# Altium project A_Board_Weather.Station.PrjPcb (part 2 of 2)

## Sheet A_Board_STM32F.SchDoc
size A2; SheetNumber: 2; SheetTotal: 4
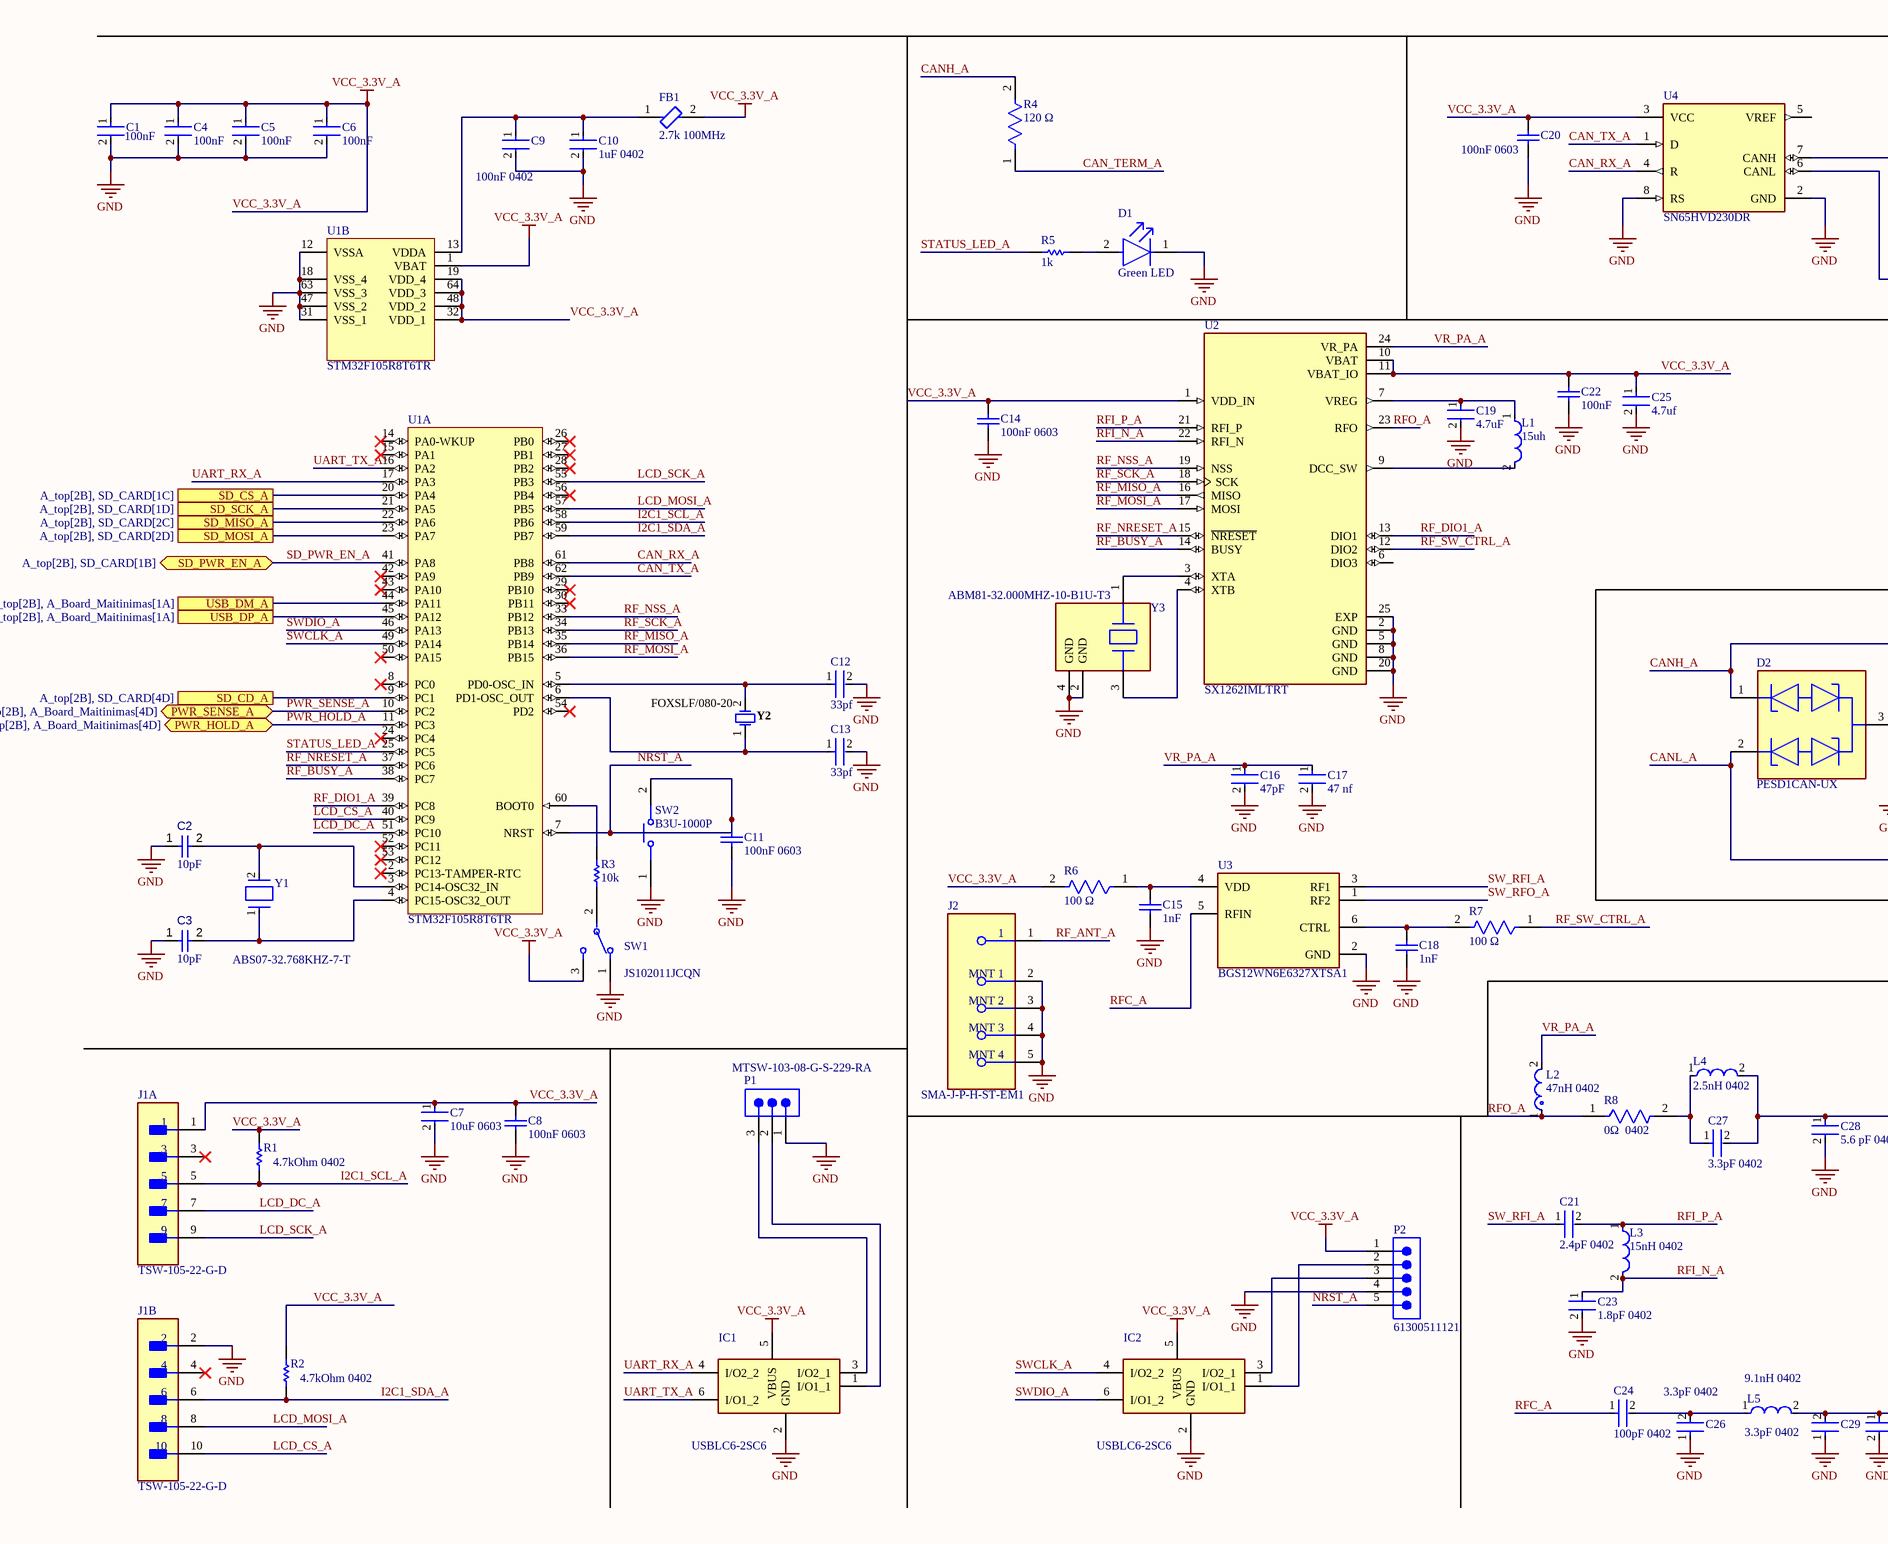
[diagram p2: A_Board_STM32F.SchDoc, left]
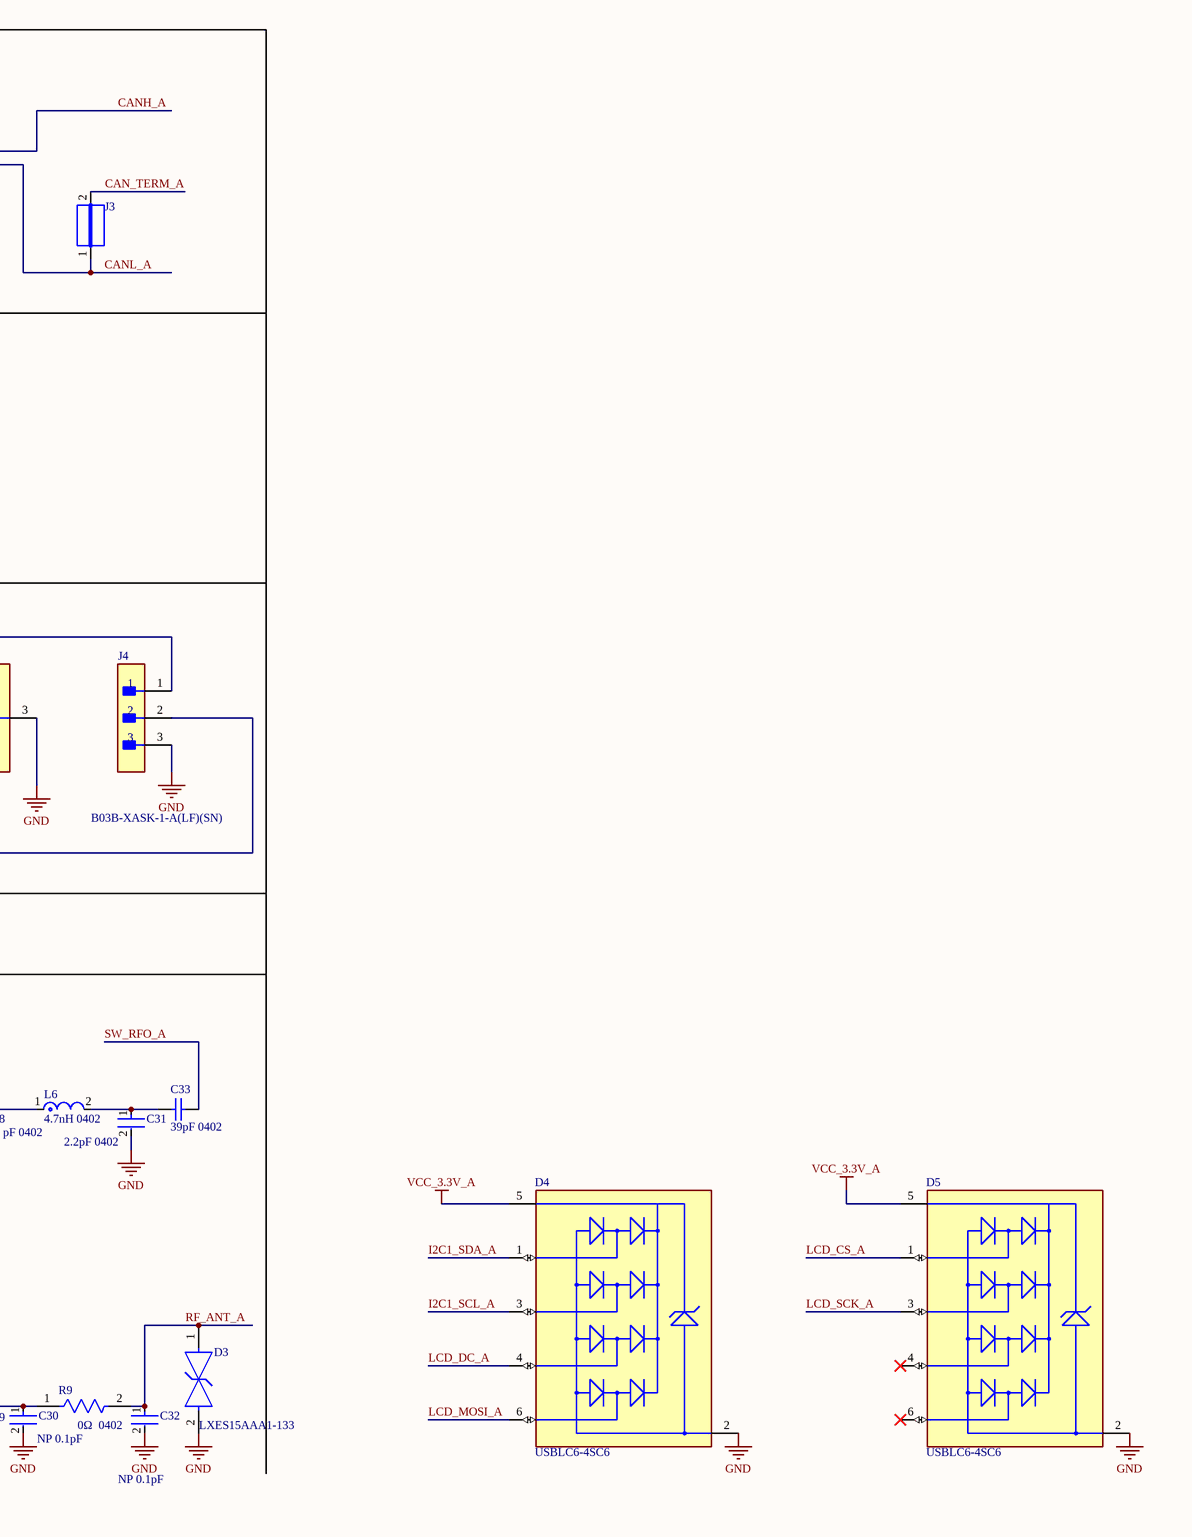
[diagram p3: A_Board_STM32F.SchDoc, right]

### Parts
C1  100nF  [FP-GRT155-0_05-IPC_B]
C2  value 10pF  [CAPC1608X90X40ML10T20]  (hidden comment: Capacitor 10 pF +/- 5% 50 V 0603)
C3  value 10pF  [CAPC1608X90X40ML10T20]  (hidden comment: Capacitor 10 pF +/- 5% 50 V 0603)
C4  100nF  [FP-GRT155-0_05-IPC_B]
C5  100nF  [FP-GRT155-0_05-IPC_B]
C6  100nF  [FP-GRT155-0_05-IPC_B]
C7  10uF 0603  [FP-ZRB18A-0_2-MFG]
C8  100nF 0603  [CAPC1608X90X35NL15T15]
C9  100nF 0402  [FP-GRT155-0_05-IPC_B]
C10  1uF 0402  [FP-CL440-IPC_C]
C11  100nF 0603  [CAPC1608X90X35NL15T15]
C12  33pf  [FP-CC0402-MFG]
C13  33pf  [FP-CC0402-MFG]
C14  100nF 0603  [CAPC1608X90X35NL15T15]
C15  1nF  [CAPC1005X60X30ML05T10]
C16  47pF  [FP-CC0402-0_05-0_55-L2_0-MFG]
C17  47 nf  [FP-C0402-BB-MFG]
C18  1nF  [CAPC1005X60X30ML05T10]
C19  4.7uF  [FP-CC1206-1_25-MFG]
C20  100nF 0603  [CAPC1608X90X35NL15T15]
C21  2.4pF 0402  [FP-GJM155-0_05-IPC_A]
C22  100nF  [CAPC1608X90X35NL15T15]
C23  1.8pF 0402  [FP-GJM155-0_05-IPC_B]
C24  100pF 0402  [FP-CC0402-MFG]
C25  4.7uf  [FP-CC1206-1_25-MFG]
C26  3.3pF 0402  [FP-GJM155-0_05-IPC_B]
C27  3.3pF 0402  [FP-GJM155-0_05-IPC_B]
C28  5.6 pF 0402  [FP-GJM155-0_05-MFG]
C29  3.3pF 0402  [FP-GJM155-0_05-IPC_B]
C30  NP 0.1pF  [FP-GJM155-0_05-IPC_B]
C31  2.2pF 0402  [FP-GJM155-0_05-IPC_C]
C32  NP 0.1pF  [FP-GJM155-0_05-IPC_B]
C33  39pF 0402  [CAPC1005X55X25LL05T10]
D1  Green LED  [FP-LTST-C171GKT-MFG]
D2  PESD1CAN-UX  [FP-SOT323-MFG]
D3  LXES15AAA1-133  [FP-LXES15-MFG]
D4  USBLC6-4SC6  [FP-SOT23-6L-MFG]
D5  USBLC6-4SC6  [FP-SOT23-6L-MFG]
FB1  2.7k 100MHz  [FP-BLM21-0_2-t1_25-e0_3-IPC_A]
IC1  USBLC6-2SC6  [SOT95P280X145-6N]
IC2  USBLC6-2SC6  [SOT95P280X145-6N]
J1  TSW-105-22-G-D  [FP-TSW-105-22-G-D-MFG]  (parts A,B of 2)
J2  SMA-J-P-H-ST-EM1  [FP-SMA-J-P-H-ST-EM1-MFG]
J3  JUMPER  [JUMPER]  (value not drawn)
J4  B03B-XASK-1-A(LF)(SN)  [FP-B03B-XASK-1-A_LF_SN-MFG]
L1  15uh  [FP-MLZ2012-1_25-IPC_C]
L2  47nH 0402  [FP-LQG15WH_02-IPC_C]
L3  15nH 0402  [FP-LQW15AN_00-W0_6-0_1-MFG]
L4  2.5nH 0402  [FP-LQW15AN_00-W0_6-0_1-MFG]
L5  9.1nH 0402  [FP-LQW15AN_00-W0_6-0_1-MFG]
L6  4.7nH 0402  [FP-LQG15HH_02-IPC_B]
P1  MTSW-103-08-G-S-229-RA  [SMTC-MTSW-103-08-X-S-229-RA]
P2  61300511121  [61300511121]
R1  4.7kOhm 0402  [RESC1005X40X25NL10T10]
R2  4.7kOhm 0402  [RESC1005X40X25NL10T10]
R3  10k  [RESC1005X40X25ML05T05]
R4  120 Ω  [FP-RMCF0201-IPC_B]
R5  1k  [RESC1005X40X25ML10T10]
R6  100 Ω  [FP-CRGCQ0402-IPC_C]
R7  100 Ω  [FP-CRGCQ0402-IPC_C]
R8  0Ω  0402  [FP-CRCW0402-e3-IPC_C]
R9  0Ω  0402  [FP-CRCW0402-e3-IPC_C]
SW1  JS102011JCQN  [FP-JS102011JCQN-MFG]
SW2  B3U-1000P  [OMRON-B3U-1000_V]
U1  STM32F105R8T6TR  [STM-LQFP64_L]  (parts A,B of 2)
U2  SX1262IMLTRT  [QFN50P400X400X100-25N]
U3  BGS12WN6E6327XTSA1  [FP-PG-TSNP-6-MFG]
U4  SN65HVD230DR  [FP-D0008A-IPC_A]
Y1  ABS07-32.768KHZ-7-T  [FP-ABS07-MFG]
Y2  FOXSLF/080-20  [FOX-FOXSLF080-20]
Y3  ABM81-32.000MHZ-10-B1U-T3  [FP-ABM81-MFG]

### Ports
PWR_HOLD_A (bidir, see A_top[2B], A_Board_Maitinimas[4D]), PWR_SENSE_A (bidir, see A_top[2B], A_Board_Maitinimas[4D]), SD_CD_A (see A_top[2B], SD_CARD[4D]), SD_CS_A (see A_top[2B], SD_CARD[1C]), SD_MISO_A (see A_top[2B], SD_CARD[2C]), SD_MOSI_A (see A_top[2B], SD_CARD[2D]), SD_PWR_EN_A (bidir, see A_top[2B], SD_CARD[1B]), SD_SCK_A (see A_top[2B], SD_CARD[1D]), USB_DM_A (see A_top[2B], A_Board_Maitinimas[1A]), USB_DP_A (see A_top[2B], A_Board_Maitinimas[1A])

### Nets
GND: C1.2 C2.1 C3.1 C4.2 C5.2 C6.2 C7.2 C8.1 C9.2 C10.2 C11.1 C12.2 C13.2 C14.1 C15.1 C16.2 C17.2 C18.1 C19.2 C20.1 C22.1 C23.2 C25.2 C26.1 C28.2 C29.1 C30.2 C31.2 C32.2 D1.1(C) D2.3(common_cathode) D3.2 D4.2(GND) D5.2(GND) IC1.2(GND) IC2.2(GND) J1.2 J2.2(MNT_1) J2.3(MNT_2) J2.4(MNT_3) J2.5(MNT_4) J4.3 P1.1 P2.4 SW1.1 SW2.1 U1.12(VSSA) U1.18(VSS_4) U1.31(VSS_1) U1.47(VSS_2) U1.63(VSS_3) U2.2(GND) U2.5(GND) U2.8(GND) U2.20(GND) U2.25(EXP) U3.2(GND) U4.2(GND) U4.8(RS) Y3.2(GND) Y3.4(GND)
VCC_3.3V_A: C1.1 C4.1 C5.1 C6.1 C7.1 C8.2 C14.2 C20.2 C22.2 C25.1 D4.5(VBUS) D5.5(VBUS) FB1.2 IC1.5(VBUS) IC2.5(VBUS) J1.1 P2.1 R1.2 R2.2 R6.2 SW1.3 U1.1(VBAT) U1.19(VDD_4) U1.32(VDD_1) U1.48(VDD_2) U1.64(VDD_3) U2.1(VDD_IN) U2.10(VBAT) U2.11(VBAT_IO) U4.3(VCC)
CAN_RX_A: U1.61(PB8) U4.4(R)
CAN_TERM_A: J3.2 R4.1
CAN_TX_A: U1.62(PB9) U4.1(D)
CANH_A: D2.1(cathode_1) J4.1 R4.2 U4.7(CANH)
CANL_A: D2.2(cathode_2) J3.1 J4.2 U4.6(CANL)
I2C1_SCL_A: D4.3(I/O2) J1.5 R1.1 U1.58(PB6)
I2C1_SDA_A: D4.1(I/O1) J1.6 R2.1 U1.59(PB7)
LCD_CS_A: D5.1(I/O1) J1.10 U1.40(PC9)
LCD_DC_A: D4.4(I/O3) J1.7 U1.51(PC10)
LCD_MOSI_A: D4.6(I/O4) J1.8 U1.57(PB5)
LCD_SCK_A: D5.3(I/O2) J1.9 U1.55(PB3)
NRST_A: C11.2 P2.5 SW2.2 U1.7(NRST)
PWR_HOLD_A: U1.11(PC3) ; port PWR_HOLD_A
PWR_SENSE_A: U1.10(PC2) ; port PWR_SENSE_A
RF_ANT_A: C32.1 D3.1 J2.1 R9.2
RF_BUSY_A: U1.38(PC7) U2.14(BUSY)
RF_DIO1_A: U1.39(PC8) U2.13(DIO1)
RF_MISO_A: U1.35(PB14) U2.16(MISO)
RF_MOSI_A: U1.36(PB15) U2.17(MOSI)
RF_NRESET_A: U1.37(PC6) U2.15(~{NRESET})
RF_NSS_A: U1.33(PB12) U2.19(NSS)
RF_SCK_A: U1.34(PB13) U2.18(SCK)
RF_SW_CTRL_A: R7.1 U2.12(DIO2)
RFC_A: C24.1 U3.5(RFIN)
RFI_N_A: C23.1 L3.2 U2.22(RFI_N)
RFI_P_A: C21.2 L3.1 U2.21(RFI_P)
RFO_A: L2.1 R8.1 U2.23(RFO)
SD_CD_A: U1.9(PC1) ; port SD_CD_A
SD_CS_A: U1.20(PA4) ; port SD_CS_A
SD_MISO_A: U1.22(PA6) ; port SD_MISO_A
SD_MOSI_A: U1.23(PA7) ; port SD_MOSI_A
SD_PWR_EN_A: U1.41(PA8) ; port SD_PWR_EN_A
SD_SCK_A: U1.21(PA5) ; port SD_SCK_A
STATUS_LED_A: R5.1 U1.25(PC5)
SW_RFI_A: C21.1 U3.3(RF1)
SW_RFO_A: C33.2 U3.1(RF2)
SWCLK_A: IC2.4(I/O2_2) U1.49(PA14)
SWDIO_A: IC2.6(I/O1_2) U1.46(PA13)
UART_RX_A: IC1.4(I/O2_2) U1.17(PA3)
UART_TX_A: IC1.6(I/O1_2) U1.16(PA2)
VR_PA_A: C16.1 C17.1 L2.2 U2.24(VR_PA)
NetC2_2: C2.2 U1.3(PC14-OSC32_IN) Y1.2
NetC3_2: C3.2 U1.4(PC15-OSC32_OUT) Y1.1
NetC9_1: C9.1 C10.1 FB1.1 U1.13(VDDA)
NetC12_1: C12.1 U1.5(PD0-OSC_IN) Y2.2
NetC13_1: C13.1 U1.6(PD1-OSC_OUT) Y2.1
NetC15_2: C15.2 R6.1 U3.4(VDD)
NetC18_2: C18.2 R7.2 U3.6(CTRL)
NetC19_1: C19.1 L1.1 U2.7(VREG)
NetC24_2: C24.2 C26.2 L5.1
NetC27_1: C27.1 L4.1 R8.2
NetC27_2: C27.2 C28.1 L4.2 L6.1
NetC29_2: C29.2 C30.1 L5.2 R9.1
NetC31_1: C31.1 C33.1 L6.2
NetD1_2: D1.2(A) R5.2
NetIC1_1: IC1.1(I/O1_1) P1.2
NetIC1_3: IC1.3(I/O2_1) P1.3
NetIC2_1: IC2.1(I/O1_1) P2.2
NetIC2_3: IC2.3(I/O2_1) P2.3
NetIC3_4: U1.44(PA11) ; port USB_DM_A
NetIC3_6: U1.45(PA12) ; port USB_DP_A
NetL1_2: L1.2 U2.9(DCC_SW)
NetR3_1: R3.1 SW1.2
NetR3_2: R3.2 U1.60(BOOT0)
NetU2_3: U2.3(XTA) Y3.1
NetU2_4: U2.4(XTB) Y3.3

Not connected (* = marked no-connect by the designer): D5 4(I/O3)* 6(I/O4)*; J1 3* 4*; U1 2(PC13-TAMPER-RTC)* 8(PC0)* 14(PA0-WKUP)* 15(PA1)* 24(PC4)* 26(PB0)* 27(PB1)* 28(PB2)* 29(PB10)* 30(PB11)* 42(PA9)* 43(PA10)* 50(PA15)* 52(PC11)* 53(PC12)* 54(PD2)* 56(PB4)*; U2 6(DIO3); U4 5(VREF)

### Library data of the parts
C1 C4-C6 C9 = CMP-06035-021603-1: Multi-Layer Ceramic Capacitor 100nF 25V X7R ±10% 0402 Paper T/R
C2 C3 = CMP-001-00014-6: Chip Capacitor, 10 pF, +/- 5%, 50 V, 0603 (1608 Metric); Capacitor Type: Ceramic; Voltage Rating: 50V; RoHS Compliant: True; Case/Package: 0603; Max Operating Temperature: 125°C; Pins: 2; Tolerance: 5%; Mounting Technology: SM; Min Operating Temperature: -55°C
C7 = CMP-06035-062601-1: CAP CER 10UF 10V X7T 0603; Tolerance: 10%; Max Operating Temperature: 125°C; Min Operating Temperature: -55°C; Length: 0.063inch; Width: 0.031inch; Case Code (Imperial): 0603; Thickness: 0.047inch; Case/Package: 0603; Mount: Surface Mount; RoHS Compliant: Yes; Case Code (Metric): 1608; Voltage Rating: 10V; Packaging: Tape and Reel; Capacitance: 10uF
C8 C11 C14 C20 C22 = CMP-2006-02299-1: Part Number: C0603C104K4RAC7013; Manufacturer: Kemet
C10 = CMP-13271-000031-1: Cap Ceramic 1uF 35V X5R ±10% SMD 0402 +85°C Paper T/R; Voltage Rating: 35V; Mount: Surface Mount; Case Code (Metric): 1005; Thickness: 0.022inch; Capacitance: 1uF; Max Operating Temperature: 85°C; Width: 0.02inch; Tolerance: 10%; Length: 0.039inch; Packaging: Tape and Reel; Case Code (Imperial): 0402; Min Operating Temperature: -55°C; Case/Package: 0402
C12 C13 = CMP-03422-000353-1: CAP CER 33PF 50V C0G/NPO 0402; Manufacturer: YAGEO; Manufacturer Part Number: CC0402JRNPO9BN330; Tolerance: 5%; Automotive Grade: NA; Material: Ceramic; Temperature Characteristic: NP0; Temperature Coefficient: 30ppm/°C; ComponentLink2Description: Datasheet; Category: Cap; Height: 0.55mm; Device Class L3: Ceramic Capacitors; Lead Free: Yes; Temperature Range High: +125°C; Device Class L1: Passive Components; Automotive: No; Device Class L2: Capacitors; RoHS: TRUE; Digikey Description: CAP CER 33PF 50V C0G/NPO 0402; Octopart: https://octopart.com/cc0402jrnpo9bn330-yageo-39467613; Mouser Description: Multilayer Ceramic Capacitors MLCC - SMD/SMT 33pF 50V NPO 5%; Temperature: -55°C to +125°C; Value: 33pF; Temperature Range Low: -55°C; Package: CC0402; Capacitance: 33pF; Footprint Url: http://www.yageo.com/exep/pages/download/literatures/UPY-C_GEN_24.pdf; Ipc Land Pattern Name: CAPC10050X50; Voltage Rating: 50V; ComponentLink2URL: http://www.yageo.com/documents/recent/UPY-GP_NP0_16V-to-50V_16.pdf
C15 C18 = CMP-1034-01610-2: Part Number: C0402C102K9RACTU; Manufacturer: Kemet
C16 = CMP-00621-00192874-1: CC0402JRNPO9BN470 Multilayer Ceramic Capacitor, 47 pF, 50 V, ± 5%, C0G (NP0), 0402 [1005 Metric]; NexarPartId: 192874; Temperature Coefficient: 30ppm/°C; Voltage: 50V; Insulation Resistance: 100GΩ; Termination: SMD/SMT; Thickness: 558.8µm; RoHS: Compliant; Length: 1mm; Halogen Free: Halogen Free; Lead Free: Lead Free; Material: Ceramic; Number of Pins: 2; REACH SVHC: No SVHC; Schedule B: 8532240020, 8532240020; Radiation Hardening: No; Weight: 652.039032µg; Capacitance: 47pF; Min Operating Temperature: -55°C; Case/Package: 0402; Height: 550µm; Voltage Rating (DC): 50V; Composition: Ceramic; Case Code (Imperial): 0402; Max Operating Temperature: 125°C; Voltage Rating (AC): 50V; Dielectric Material: Ceramic; Voltage Rating: 50V; Mount: Surface Mount; Tolerance: 5%; Dielectric: C0G; Depth: 500µm; Case Code (Metric): 1005
C17 = CMP-03020-011259-1: CAP CER 0.047UF 16V X7R 0402; Manufacturer Part Number: C0402C473K4RACAUTO; Manufacturer: Kemet; Temperature Coefficient: 15%; Capacitance: 47,000 pF; Material: Ceramic; Tolerance: 0.1; Value: 47,000 pF; Voltage Rating: 16 V; Mouser Description: Cap Ceramic 0.047uF 16V X7R 10% Pad SMD 0402 125°C Automotive T/R; ComponentLink2Description: Datasheet; Temperature Range Low: -55°C; Ipc Land Pattern Name: CAPC10050X50; Digikey Description: CAP CER 0.047UF 16V X7R 0402; Device Class L2: Capacitors; Height: 0.55mm; ComponentLink2URL: https://content.kemet.com/datasheets/KEM_C1002_X7R_SMD.pdf; Temperature Characteristic: X7R; Lead Free: Yes; Octopart: https://octopart.com/c0402c473k4racauto-kemet-33302865; Device Class L1: Passive Components; Temperature: -55°C to +125°C; Category: Cap; Package: C0402-BB; Automotive: No; Temperature Range High: +125°C; Device Class L3: Ceramic Capacitors; RoHS: TRUE
C19 C25 = CMP-03422-000808-1: CC1206 4.7 uF X7R 10.00%25 V; Manufacturer Part Number: CC1206KFX7R8BB475; Manufacturer: Yageo; Automotive Grade: NA; Material: Ceramic; Voltage Rating: 25 V; Tolerance: 0.1; Temperature Coefficient: 15%; Device Class L2: Capacitors; Device Class L1: Passive Components; Category: Cap; Automotive: No; Capacitance: 4.7 uF; ComponentLink2URL: http://www.yageo.com/documents/recent/UPY-NP0X7R_HV_1KV-to-3KV_11.pdf; Octopart: https://octopart.com/cc1206kfx7r8bb475-yageo-80904472; Value: 4.7 uF; Footprint Url: http://www.yageo.com/exep/pages/download/literatures/UPY-C_GEN_24.pdf; Lead Free: Yes; Temperature Characteristic: X7R; ComponentLink2Description: Datasheet; Temperature Range Low: -55°C; Package: CC1206-1.25; RoHS: TRUE; Device Class L3: Ceramic Capacitors; Temperature: -55°C to +125°C; Height: 1.45mm; Temperature Range High: +125°C
C21 = CMP-2008-03838-2: Multi-Layer Ceramic Capacitor 2.4pF C0G  ±0.1pF 0402 Paper T/R; Voltage Rating: 50V; Height: 0.5mm; Dielectric: C0G; Thickness: 0.022inch; Case Code (Imperial): 0402; Width: 0.02inch; Max Operating Temperature: 125°C; Length: 1mm; Radiation Hardening: No; Min Operating Temperature: -55°C; Case/Package: 0402; Voltage Rating (DC): 50V; Depth: 0.5mm; Voltage: 50V; Mount: Surface Mount; Capacitance: 2.4pF; Termination: SMD/SMT; Lead Free: Lead Free; Package Quantity: 1; Packaging: Tape and Reel; Case Code (Metric): 1005
C23 = CMP-2008-03827-2: Multi-Layer Ceramic Capacitor 1.8pF C0G  ±0.05pF 0402 Paper T/R; Voltage Rating: 50V; Depth: 0.5mm; Length: 1mm; Case Code (Imperial): 0402; Case/Package: 0402; Min Operating Temperature: -55°C; Width: 0.5mm; Voltage Rating (DC): 50V; Termination: SMD/SMT; Case Code (Metric): 1005; Dielectric: C0G; Height: 0.5mm; Max Operating Temperature: 125°C; Lead Free: Lead Free; Thickness: 0.022inch; Packaging: Tape and Reel; Mount: Surface Mount; Radiation Hardening: No; Capacitance: 1.8pF; Package Quantity: 10000
C24 = CMP-03422-000275-1: CAP CER 100PF 25V X7R 0402; Manufacturer Part Number: CC0402KRX7R8BB101; Manufacturer: YAGEO; Material: Ceramic; Tolerance: 0.1; Automotive Grade: NA; Temperature Coefficient: 30ppm/°C; ComponentLink2Description: Datasheet; Device Class L2: Capacitors; Digikey Description: CAP CER 100PF 25V X7R 0402; Category: Cap; Ipc Land Pattern Name: CAPC10050X50; Height: 0.55mm; Lead Free: Yes; Temperature Range High: +125°C; Octopart: https://octopart.com/cc0402krx7r8bb101-yageo-71334371; Automotive: No; Device Class L3: Ceramic Capacitors; ComponentLink2URL: http://www.yageo.com/documents/recent/UPY-GP_NP0_16V-to-50V_16.pdf; Value: 100 pF; Voltage Rating: 25 V; Temperature: -55°C to +125°C; Capacitance: 100 pF; Temperature Characteristic: X7R; Footprint Url: http://www.yageo.com/exep/pages/download/literatures/UPY-C_GEN_24.pdf; Mouser Description: 0402 100 pF ±10% Tolerance X7R Multilayer Ceramic Chip Capacitor; Device Class L1: Passive Components; Temperature Range Low: -55°C; RoHS: TRUE; Package: CC0402
C26 C27 C29 = CMP-2008-03847-2: Multi-Layer Ceramic Capacitor 3.3pF C0G  ±0.25pF 0402 Paper T/R; Voltage: 50V; Length: 1mm; Dielectric: C0G; Capacitance: 3.3pF; Case Code (Metric): 1005; Max Operating Temperature: 125°C; Min Operating Temperature: -55°C; Case/Package: 0402; Package Quantity: 1; Termination: SMD/SMT; Thickness: 0.022inch; Width: 0.5mm; Mount: Surface Mount; Voltage Rating (DC): 50V; Height: 0.5mm; Voltage Rating: 50V; Lead Free: Lead Free; Radiation Hardening: No; Case Code (Imperial): 0402; Depth: 0.5mm; Packaging: Tape and Reel
C28 = CMP-2008-03865-2: Multi-Layer Ceramic Capacitor 5.6pF C0G  ±0.1pF 0402 Paper T/R; Voltage Rating (DC): 50V; Max Operating Temperature: 125°C; Capacitance: 5.6pF; Mount: Surface Mount; REACH SVHC: No SVHC; Case Code (Metric): 1005; Case/Package: 0402; Packaging: Tape and Reel; Min Operating Temperature: -55°C; Number of Pins: 2; Radiation Hardening: No; Package Quantity: 10000; Lead Pitch: 0.3mm; Width: 0.5mm; Voltage Rating: 50V; Thickness: 0.022inch; Length: 1mm; Termination: SMD/SMT; Height: 0.5mm; Case Code (Imperial): 0402; Depth: 0.5mm; Dielectric: C0G
C30 C32 = CMP-2008-03808-2: Multi-Layer Ceramic Capacitor 1pF C0G  ±0.1pF 0402 Paper T/R; Temperature Coefficient: 30ppm/°C; Voltage Rating (DC): 50V; REACH SVHC: No SVHC; Packaging: Tape and Reel; Width: 0.02inch; Package Quantity: 10000; Min Operating Temperature: -55°C; Case Code (Imperial): 0402; Lead Pitch: 0.3mm; Capacitance: 1pF; Length: 1mm; Max Operating Temperature: 125°C; Depth: 0.5mm; Thickness: 0.022inch; Case Code (Metric): 1005; Lead Free: Lead Free; Voltage: 50V; Mount: Surface Mount; Number of Pins: 2; Termination: SMD/SMT; Radiation Hardening: No; Dielectric: C0G; Case/Package: 0402; Voltage Rating: 50V; Height: 0.5mm
C31 = CMP-2008-03835-2: Multi-Layer Ceramic Capacitor 2.2pF C0G  ±0.1pF 0402 Paper T/R; Voltage Rating: 50V; Temperature Coefficient: 30ppm/°C; Width: 0.5mm; Dielectric: C0G; Mount: Surface Mount; Thickness: 0.022inch; Lead Pitch: 0.3mm; Depth: 0.5mm; Case Code (Metric): 1005; Lead Free: Lead Free; Min Operating Temperature: -55°C; Number of Pins: 2; Radiation Hardening: No; Case/Package: 0402; Voltage: 50V; Max Operating Temperature: 125°C; Height: 0.5mm; Package Quantity: 10000; Capacitance: 2.2pF; REACH SVHC: No SVHC; Packaging: Tape and Reel; Case Code (Imperial): 0402; Termination: SMD/SMT; Voltage Rating (DC): 50V; Length: 1mm
C33 = CMP-2008-03921-1: Part Number: GRM1555C1H390JA01D; Manufacturer: Murata
D1 = CMP-22017-000007-1: LED GREEN CLEAR CHIP SMD; Luminous Intensity: 12mcd; Lens Color: Colorless; Dominant Wavelength: 569nm; Number of LEDs: 1; Power Dissipation: 100mW; Viewing Angle: 130°; Reverse Voltage: 5V; Test Current: 10mA; Forward Voltage: 2.1V; Wavelength: 585nm; Lens Style: Diffused; Forward Current: 30mA; Height: 0.8mm; Mount: Surface Mount; Package Quantity: 1; Length: 2mm; Case Code (Metric): 2012; Number of Pins: 2; Number of Elements: 1; Packaging: Tape and Reel; Color: Green; Min Operating Temperature: -55°C; Case/Package: 0805; Power Rating: 100mW; Max Operating Temperature: 85°C; Radiation Hardening: No; Depth: 1.25mm; Lens Transparency: Clear; Width: 1.25mm; Lead Free: Lead Free; Case Code (Imperial): 0805; Illumination Color: Green
D2 = CMP-14436-000006-1: TVS DIODE 24V 50V SC70-3
D3 = CMP-06195-000011-1: TVS DIODE 15V 1005; Number of Bidirectional Channels: 1; Power Line Protection: No; Mount: Surface Mount; Case Code (Metric): 1005; Min Operating Temperature: -40°C; Case Code (Imperial): 0402; Resistor Type: Zener; Reverse Standoff Voltage: 15V; Case/Package: 0402; Packaging: Tape and Reel; Max Operating Temperature: 85°C
D4 D5 = CMP-2000-07370-2: TVS DIODE 5.25V 17V SOT23-6; Manufacturer: STMicroelectronics; Peak Pulse Power: 130W; Breakdown Voltage: 6V; Value: 3pF; Direction: Unidirectional; Interface: USB,Ethernet,Other; Number Of Channels: 4; Standoff Height: 0mm; Max Junction Temp: +125°C; Digikey Description: TVS DIODE 5.25V 17V SOT23-6; Automotive: No; Package: SOT23-6L; Mouser Description: USBLC6 Series 4 Line 6 V Uni / Bi-Directional ESD Protection - SOT-23-6; Octopart: https://octopart.com/usblc6-4sc6-stmicroelectronics-347147; RoHS: TRUE; ComponentLink2URL: https://upverter.com/datasheet/23dc4ffb028d868909e80577610284b194f13213.pdf; ComponentLink2Description: Datasheet; Device Class L1: Circuit Protection; Lead Free: Yes; Temperature Range High: +125°C; Device Class L2: ESD and Circuit Protection ICs; Device Class L3: unset; Capacitance: 3pF; Height: 1.45mm; Temperature Range Low: -40°C; Manufacturer Part Number: USBLC6-4SC6; Temperature: -40°C to +125°C; Category: Diode; Clamping Voltage: 17V
FB1 = CMP-06046-001048-1: FERRITE BEAD 2700 OHM 0201 1LN BLM21BD272SZ1L
IC1 IC2 = USBLC6-2SC6: Integrated Circuit; Manufacturer_Name: STMicroelectronics; Datasheet Link: https://www.st.com/resource/en/datasheet/usblc6-2.pdf; Height: 1.45mm; Manufacturer_Part_Number: USBLC6-2SC6; Mouser Part Number: 511-USBLC6-2SC6; Mouser Price/Stock: https://www.mouser.co.uk/ProductDetail/STMicroelectronics/USBLC6-2SC6?qs=po45yt2pPpu%2FhNIlwQdTlg%3D%3D; Arrow Part Number: USBLC6-2SC6; Arrow Price/Stock: https://www.arrow.com/en/products/usblc6-2sc6/stmicroelectronics.html?utm_currency=USD&region=asia
J1 = CMP-02766-000106-1: CONN HEADER VERT 10POS 2.54MM; Max Current Rating: 7.6A; Max Voltage Rating (AC): 550V; Number of Contacts: 10; Gender: Male; Length: 12.7mm; Depth: 5.08mm; Min Operating Temperature: -55°C; REACH SVHC: No SVHC; Termination: Solder; Number of Rows: 2; Housing Color: Black; Orientation: Straight; Pitch: 2.54mm; Contact Plating: Gold; Packaging: Bulk; Housing Material: Polyester; Contact Material: Bronze; Max Operating Temperature: 125°C
J2 = CMP-02754-000006-1: CONN SMA JACK STR 50OHM EDGE MNT; Dielectric Material: PTFE; Center Contact Plating: Gold; Max Frequency: 6GHz; Body Material: Brass; Voltage Rating: 335V; Impedance: 50R; Package Quantity: 1; Case/Package: SMA; Max Operating Temperature: 125°C; Fastening Type: Threaded; Orientation: Straight; Depth: 13.33mm; RoHS Compliant: Yes; Length: 6.35mm; Insulation Material: Polytetrafluoroethylene; Termination: Solder; Min Operating Temperature: -65°C; Housing Color: Gold; Contact Plating: Gold; Contact Material: Copper; Connector Type: SMA; Mount: Edge; Series: SMA; Packaging: Tray; Body Plating: Gold; Radiation Hardening: No
J3 = CMP-009-00061-2: Pins: 2
J4 = CMP-17439-000540-1: CONN HEADER VERT 3POS 2.5MM; Number of Positions: 3; Voltage Rating: 250V; Mated Stacking Heights: 11.3mm; Contact Shape: Circular; Pitch: 2.5mm; Lead Free: Lead Free; Connector Type: Header; Flammability Rating: UL94 V-0; Contact Material: Copper Alloy; Packaging: Bulk; Insulation Color: Natural; Fastening Type: Ramp; Contact Type: Male Pin; Series: XA; Termination: Press-Fit; Contact Finish - Mating: TIN; Insulation Material: Nylon; Number of Rows: 1; Mount: Through Hole
L1 = CMP-08253-000252-1: Shielded Multilayer Inductor 15uH ±20% 250mA 1235mΩ SMD 0805; Core Material: Ferrite; Saturation Current: 120mA; DC Resistance (DCR): 1.235R; Test Frequency: 2MHz; Self Resonant Frequency: 40MHz; Case/Package: 0805; Mount: Surface Mount; Package Quantity: 1; Current Rating: 250mA; Inductance: 15uH; Case Code (Metric): 2012; Max Operating Temperature: 125°C; Height - Seated (Max): 0.057inch; Width: 0.049inch; Length: 0.079inch; Shielding: Shielded; RoHS Compliant: Yes; Case Code (Imperial): 0805; Packaging: Tape and Reel; Min Operating Temperature: -55°C; Tolerance: 20%
L2 = CMP-06042-012463-1: Multilayer type Inductor for Automotive 47nH ±2% 1.6Ω 190mA 0402
L3 = CMP-06042-012641-1: Wire Wound RF Inductor 15nH ±2% 460mA 0.16Ω 0402 (1005); Core Material: Non-Magnetic; Current: 310mA; Self Resonant Frequency: 5GHz; Test Frequency: 100MHz; DC Resistance (DCR): 160mR; Shielding: Unshielded; Length: 1mm; REACH SVHC: No SVHC; Case Code (Imperial): 0402; Packaging: Tape and Reel; Case/Package: 0402; Weight: 2.8E-05oz; Current Rating: 460mA; Termination: SMD/SMT; Height - Seated (Max): 0.024inch; Inductance Tolerance: 2%; Height: 0.5mm; Military Standard: Not; Tolerance: 2%; Width: 0.5mm; Depth: 0.7mm; Min Operating Temperature: -55°C; Number of Pins: 2; Lead Free: Lead Free; Case Code (Metric): 1005; Max DC Current: 460mA; Max Operating Temperature: 125°C; Package Quantity: 10000; Mount: Surface Mount; Radiation Hardening: No; Resistor Type: Wirewound; DC Current: 460mA; Inductance: 15nH
L4 = CMP-06042-007620-1: Wire Wound RF Inductor 2.5nH ±0.1nH 850mA 0.05Ω 0402 (1005); Self Resonant Frequency: 15GHz; Core Material: Air; Q Factor: 20; DC Resistance (DCR): 50mR; Test Frequency: 100MHz; Shielding: Unshielded; Min Operating Temperature: -55°C; Case/Package: 0402; Military Standard: Not; Mount: Surface Mount; Packaging: Tape and Reel; Radiation Hardening: No; Height - Seated (Max): 0.024inch; Current Rating: 850mA; Inductance: 2.5nH; Height: 0.5mm; Max DC Current: 850mA; Case Code (Metric): 1005; Weight: 2.8E-05oz; Case Code (Imperial): 0402; Length: 1mm; Depth: 0.7mm; REACH SVHC: No SVHC; Width: 0.5mm; Max Operating Temperature: 125°C; Termination: SMD/SMT; Package Quantity: 1; Resistor Type: Wirewound; DC Current: 850mA
L5 = CMP-06042-009985-1: Wire Wound RF Inductor 9.1nH ±2% 540mA 0.14Ω 0402 (1005); Test Frequency: 100MHz; DC Resistance (DCR): 140mR; Core Material: Air; Shielding: Unshielded; Self Resonant Frequency: 5.5GHz; Q Factor: 25; Mount: Surface Mount; Length: 1mm; Width: 0.02inch; Packaging: Tape and Reel; Package Quantity: 1; Case Code (Imperial): 0402; Case/Package: 0402; Depth: 0.7mm; Number of Pins: 2; Min Operating Temperature: -55°C; Max DC Current: 540mA; DC Current: 540mA; REACH SVHC: No SVHC; Height: 0.5mm; Case Code (Metric): 1005; Max Operating Temperature: 125°C; Termination: SMD/SMT; Tolerance: 2%; Current Rating: 540mA; Inductance Tolerance: 2%; Weight: 2.8E-05oz; Military Standard: Not; Lead Free: Lead Free; Inductance: 9.1nH; Radiation Hardening: No
L6 = CMP-06042-003214-1: Multilayer type RF Inductor 4.7nH ±0.2nH 0.16Ω 700mA 0402; Self Resonant Frequency: 6GHz; Core Material: Air; DC Resistance (DCR): 160mR; Shielding: Unshielded; Test Frequency: 100MHz; Case Code (Metric): 1005; Packaging: Cut Tape; Case Code (Imperial): 0402; Max Operating Temperature: 125°C; Current Rating: 700mA; Inductance: 4.7nH; Mount: Surface Mount; Case/Package: 0402; Min Operating Temperature: -55°C
P1 = CMP-1024-00100-1: Modified .025" SQ Post Header, Through-hole, Right Angle, -55 to 125 degC, 2.54 mm Pitch, 3-Pin, Male, RoHS; Manufacturer: Samtec; Pitch: 2.54 mm; ComponentLink1URL: http://www.samtec.com; ComponentLink3Description: Package Specification; Mounting Technology: Through-hole; PackageDescription: Assembly .025" [.64] SQ Post Terminal Strip; ComponentLink2URL: http://www.samtec.com/documents/webfiles/pdf/MTSW.PDF; PackageVersion: BI, 2/1987; ComponentLink1Description: Manufacturer URL; PackageReference: MTSW-103-08-X-S-229-RA; Orientation: Right Angle; DatasheetVersion: F-214; PartNumber: MTSW-103-08-G-S-229-RA; RoHS: True; Temperature Range: -55 to 125 degC; ComponentLink3URL: http://www.samtec.com/documents/webfiles/cpdf/MTSW-XXX-XX-X-X-XXXX-XX-XXX-MKT1.pdf; ComponentLink2Description: Datasheet
P2 = CMP-1502-01068-4: THT Vertical Pin Header WR-PHD, Pitch 2.54 mm, Single Row, 5 pins; Number of Contacts: 5; Connector Type: Male Pin; Operating Supply Voltage: 250V; Contact Resistance: 20mΩ; Gender: Male; Pitch: 2.54mm; Current Rating: 3A; Min Operating Temperature: -40°C; Contact Material: Gold; Color: Black; RoHS: Compliant; Number of Rows: 1; Lead Free: Lead Free; Height: 8.89mm; Contact Plating: Gold; Number of Pins: 5; Orientation: Vertical; Voltage Rating: 250V; Packaging: Bulk; Number of Positions: 5; Max Operating Temperature: 105°C; Termination: Solder; Lead Pitch: 2.54mm; Contact Mating Length: 5.9944mm; Mount: Through Hole
R1 R2 = CMP-2002-05217-1: Manufacturer: Bourns; Part Number: CR0402-FX-4701GLF
R3 = CMP-2002-01181-1: Manufacturer: Panasonic; Part Number: ERT-J0EM103J
R4 = CMP-26527-005399-1: 120Ω ±5% 0.05W 0201 Thick Film Chip Resistor AEC-Q200 compliant; Resistance: 120R; Temperature Coefficient: 200ppm/°C; Max Power Dissipation: 50mW; Number of Terminations: 2; Mount: Surface Mount; Resistor Type: Thick Film; RoHS Compliant: Yes; Case/Package: 0201; Width: 0.012inch; Max Operating Temperature: 125°C; Tolerance: 5%; Radiation Hardening: No; Case Code (Metric): 0603; Min Operating Temperature: -55°C; Height: 0.009inch; Length: 0.024inch; Contact Plating: Tin; Case Code (Imperial): 0201; Packaging: Tape and Reel
R5 = CMP-2002-04581-1: Manufacturer: KOA Speer; Part Number: SG73P1ETTP1001F
R6 R7 = CMP-03211-004684-1: CRGCQ 0402 100R 5%; Manufacturer Part Number: CRGCQ0402J100R; Manufacturer: TE Connectivity; Value: 100Ω; Power Rating: 0.0625W; Temperature Coefficient: ±200ppm/°C; Voltage Rating: 50V; Tolerance: 0.05; RoHS: TRUE; ComponentLink2Description: Datasheet; Lead Free: Yes; Temperature: -55°C to +155°C; Series: CRGCQ; Package: CRGCQ0402; Composition: Thick Film; Digikey Description: CRGCQ 0402 100R 5%; Device Class L1: Passive Components; Temperature Range High: +155°C; Octopart: https://octopart.com/crgcq0402j100r-te+connectivity-91017992; Ambient Temperature Range High: +70°C; Device Class L3: Chip SMD Resistors; Automotive: Yes; ComponentLink2URL: https://www.te.com/commerce/DocumentDelivery/DDEController?Action=showdoc&DocId=Data+Sheet%7F1773204-3%7F1%7Fpdf%7FEnglish%7FENG_DS_1773204-3_1.pdf%7F4-2176347-467; Height: 0.4mm; Temperature Range Low: -55°C; Mouser Description: Res, Auto, Thick Film, 100R, 5%, 0402; Category: Res; Ipc Land Pattern Name: RESC10050X35; Resistance: 100Ω; Device Class L2: Resistors
R8 R9 = CMP-2002-08122-2: RES Thick Film, 0Ω, 0.063W, 0402; Tolerance: 5%; Max Power Dissipation: 63mW; Voltage Rating: 50V; Temperature Coefficient: 100ppm/°C; Resistance: 0mR; Contact Plating: Tin; Height: 0.35mm; Radiation Hardening: No; Features: Automotive AEC-Q200; Composition: Thick Film; Width: 0.5mm; Weight: 2.3E-05oz; Termination: SMD/SMT; Packaging: Tape and Reel; Mount: Surface Mount; Case Code (Metric): 1005; Military Standard: Not; Min Operating Temperature: -55°C; Number of Terminations: 2; Package Quantity: 1; Case Code (Imperial): 0402; Depth: 0.5mm; Max Operating Temperature: 155°C; Case/Package: 0402; Power Rating: 63mW; Lead Free: Lead Free; Voltage Rating (DC): 50V; Length: 1mm
SW1 = CMP-10038-000010-1: SWITCH SLIDE SPDT 300MA 6V; Electrical Life: 5000Cycles; Switch Function: On-On; Actuator Material: Nylon; Actuator Length: 2mm; Actuator Type: Standard; Current Rating: 300mA; Voltage Rating (DC): 6V; Min Operating Temperature: -40°C; Throw Configuration: SPDT; Mount: Surface Mount; Switch Travel: 2mm; Max Operating Temperature: 85°C; Packaging: Cut Tape; Contact Plating: Silver; Contact Material: Copper Alloy
SW2 = CMP-011-00000-2: Tactile Switch, SPST-NO, 0.05 A, 12 V, -25 to 70 degC, 2-Pin SMD, RoHS, Tape and Reel; Manufacturer: Omron Electronic Components; IP Rating: IP40; Current Rating: 50mA; Max Contact Resistance: 100mohm; Operating Force: 153gf; Throw Configuration: SPST; Resistance: 0.1Ohm; Max Voltage Rating (DC): 12V; Contact Material: Silver; Max Current Rating: 50mA; Datasheet URL: http://www.omron.com/ecb/products/pdf/en-b3u.pdf; Mounting Technology: SM; Case/Package: B3U-1000; Packaging: TapeandReel; Package Reference: B3U-1000; Manufacturer URL: http://www.omron.com/; Datasheet Version: Jan-15; RoHS Compliant: True; Max Operating Temperature: 70°C; Contact Current Rating: 50mA; Package Quantity: 3500; Package Description: 2-Pin Surface Mount Device, Body 3 x 2.5 mm; Voltage Rating (DC): 12V; Min Operating Temperature: -25°C; Voltage Rating: 12V
U1 = CMP-0237-00288-2: ARM Cortex-M3 32-bit MCU, 64 KB Flash, 64 KB Internal RAM, 51 I/Os, 64-pin LQFP, -40 to 85 degC, Tape and Reel; I/Os (High Current): 51; FLASH Size (Prog) (kB): 64; Operating Frequency(F) (Processor speed) (MHz): 72; Supply Voltage(Vcc) min (V): 2; A/D Converter: 2x12-bit (16 Channel); D/A Converter: 2x12-bit (2 Channel); PackageReference: LQFP64; PartNumber: STM32F105R8T6TR; Packing: Tape and Reel; ComponentLink3Description: Package Specification; ComponentLink2Description: Datasheet; PackageVersion: Rev. 4, 06/2013; ComponentLink3URL: http://www.st.com/st-web-ui/static/active/en/resource/technical/document/datasheet/DM00037051.pdf; ComponentLink2URL: http://www.st.com/st-web-ui/static/active/en/resource/technical/document/datasheet/CD00220364.pdf; Mounting Technology: Surface Mount; ComponentLink1URL: http://www.st.com/web/en/home.html; PackageDescription: 64-Pin Low Profile Quad Flat Package, 10 x 10 mm Body, 0.5 mm Pitch; Core: ARM Cortex-M3; Internal RAM Size (kB): 64; ComponentLink1Description: Manufacturer URL; DatasheetVersion: Rev. 6
U2 = SX1262IMLTRT: IC RF TxRx Only General ISM < 1GHz LoRaWAN 150MHz ~ 960MHz 24-VFQFN Exposed Pad; MF: Semtech Corporation; Value: *; SnapEDA_Link: https://www.snapeda.com/parts/SX1262IMLTRT/Semtech%20Corporation/view-part/2781045/?ref=snap; Availability: Unavailable; Package: VFQFN-24 Semtech; Price: None; MP: SX1262IMLTRT
U3 = CMP-32859-000005-1: CMOS SWITCH
U4 = CMP-0315-00015-3: IC TRANSCEIVER HALF 1/1 8SOIC; Number of Transceivers: 1; Operating Supply Voltage: 3.3V; Number of I/Os: 2; Max Supply Current: 17mA; Max Supply Voltage: 3.6V; Min Supply Voltage: 3V; Data Rate: 1Mbps; Min Operating Temperature: -40°C; Packaging: Tape and Reel; Lead Free: Lead Free; Number of Transmit Buffers: 1; Max Operating Temperature: 85°C; Number of Receive Buffers: 1; Number of Pins: 8; Package Quantity: 1; Radiation Hardening: No; Case/Package: D; REACH SVHC: No SVHC; Weight: 0.002561oz; Termination: SMD/SMT; Contact Plating: Gold; Nominal Supply Current: 17mA; Number of Receivers: 1; Number of Drivers: 1
Y1 = CMP-27762-014373-1: Crystal 32.768kHz ±20ppm (Tol) 7pF FUND 70kΩ 2-Pin CSMD T/R; Insulation Resistance: 500MR; Series Resistance: 70kR; Mount: Surface Mount; Tolerance: 20ppm; Length: 3.2mm; Lead Free: Lead Free; Frequency: 32.768kHz; Frequency Tolerance: 20ppm; Frequency Stability: 20ppm; Load Capacitance: 7pF; Radiation Hardening: No; Package Quantity: 3000; Width: 1.5mm; Height: 0.9mm; Termination: SMD/SMT; Max Operating Temperature: 85°C; Number of Pins: 2; Operating Frequency: 32.768 kHz; ESR (Equivalent Series Resistance): 70kR; Packaging: Tape and Reel; Series: ABS07; Min Operating Temperature: -40°C; Depth: 1.5mm; Case/Package: CSMD
Y2 = CMP-1749-00002-1: Resistance Weld Thru-Hole Crystal, 8 MHz, -20 to 70 degC, 2-Pin THD, RoHS, Bulk; Dropout Voltage: 2 V; Outputs: 1; Nominal Output Voltage: 5 V; Min Input Voltage: 7 V; Case\Package: TO-263-3; Max Input Voltage: 35 V; Max Ouput Current: 1 A; Length: 10.24 mm; Max Operating Temperature: 125 degC; Mount: Surface Mount; PackageDescription: 2-Pin Through Hole Device, Body 11.35 x 4.65 mm; Package Quantity: 50; Pins: 3; ComponentLink2URL: http://download.siliconexpert.com/pdfs/2015/4/5/6/5/7/200/fox_/manual/35607121449963728hc49slf.pdf; PackageReference: FOXSLF080-20; Min Operating Temperature: 0 degC; Height: 30.02 mm; Packaging: Rail/Tube; Radiation Hardening: No; Width: 9.35 mm; ComponentLink1URL: http://www.foxonline.com/; DatasheetVersion: Mar-15; ComponentLink1Description: Manufacturer URL; Output Voltage: 5 V; RoHSCompliant: true; REACH SVHC: No SVHC; Output Current: 1 A; ComponentLink2Description: Datasheet
Y3 = CMP-27762-001623-1: Crystal 32MHz ±10ppm 10pF SMD-4 3.2mm x 2.5mm; ESR (Equivalent Series Resistance): 40R; Frequency Tolerance: 10ppm; Max Operating Temperature: 70°C; RoHS Compliant: Yes; Frequency: 32MHz; Mount: Surface Mount; Width: 0.098inch; Min Operating Temperature: -20°C; Height: 0.028inch; Packaging: Tape and Reel; Frequency Stability: 10ppm; Length: 0.126inch; Package Quantity: 3000; Load Capacitance: 10pF; Case/Package: SMD/SMT

## Sheet SD_CARD.SchDoc
size A4; SheetNumber: 4; SheetTotal: 4
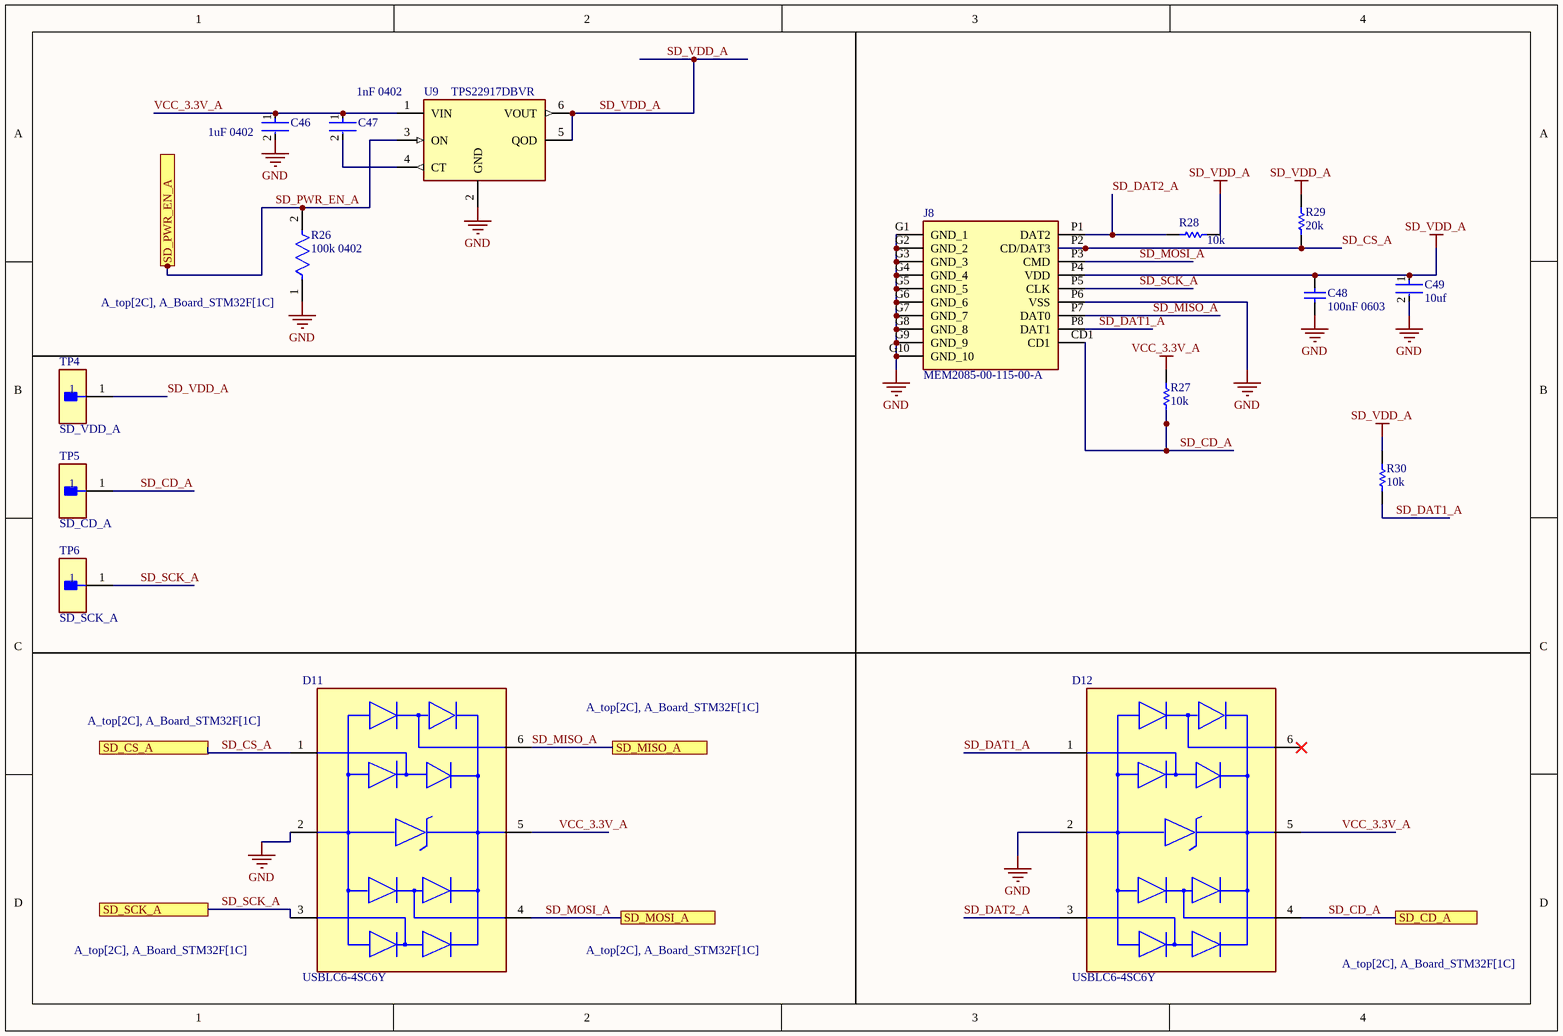
[diagram p4: SD_CARD.SchDoc]

### Parts
C46  1uF 0402  [FP-CL511-IPC_C]
C47  1nF 0402  [FP-C0402-BB-MFG]
C48  100nF 0603  [CAPC1608X90X35NL15T15]
C49  10uf  [FP-CL05A106MP5NUNC-MFG]
D11  USBLC6-4SC6Y  [FP-SOT23-6L-MFG]
D12  USBLC6-4SC6Y  [FP-SOT23-6L-MFG]
J8  MEM2085-00-115-00-A  [MEM20850011500A]
R26  100k 0402  [FP-CRGCQ0402-IPC_C]
R27  10k  [RESC0603X26X15LL03T05]
R28  10k  [RESC0603X26X15LL03T05]
R29  20k  [RESC1005X40X25ML05T05]
R30  10k  [RESC0603X26X15LL03T05]
TP4  SD_VDD_A  [FP-5015-MFG]
TP5  SD_CD_A  [FP-5015-MFG]
TP6  SD_SCK_A  [FP-5015-MFG]
U9  TPS22917DBVR  [FP-DBV0006A-IPC_A]

### Ports
SD_CD_A (see A_top[2C], A_Board_STM32F[1C]), SD_CS_A (see A_top[2C], A_Board_STM32F[1C]), SD_MISO_A (see A_top[2C], A_Board_STM32F[1C]), SD_MOSI_A (see A_top[2C], A_Board_STM32F[1C]), SD_PWR_EN_A (see A_top[2C], A_Board_STM32F[1C]), SD_SCK_A (see A_top[2C], A_Board_STM32F[1C])

### Nets
GND: C46.2 C48.1 C49.2 D11.2(GND) D12.2(GND) J8.G1(GND_1) J8.G2(GND_2) J8.G3(GND_3) J8.G4(GND_4) J8.G5(GND_5) J8.G6(GND_6) J8.G7(GND_7) J8.G8(GND_8) J8.G9(GND_9) J8.G10(GND_10) J8.P6(VSS) R26.1 U9.2(GND)
SD_VDD_A: C48.2 C49.1 J8.P4(VDD) R28.2 R29.2 R30.2 TP4.1 U9.5(QOD) U9.6(VOUT)
VCC_3.3V_A: C46.1 C47.1 D11.5(VBUS) D12.5(VBUS) R27.2 U9.1(VIN)
SD_CD_A: D12.4(I/O3) J8.CD1 R27.1 TP5.1 ; port SD_CD_A
SD_CS_A: D11.1(I/O1) J8.P2(CD/DAT3) R29.1 ; port SD_CS_A
SD_DAT1_A: D12.1(I/O1) J8.P8(DAT1) R30.1
SD_DAT2_A: D12.3(I/O2) J8.P1(DAT2) R28.1
SD_MISO_A: D11.6(I/O4) J8.P7(DAT0) ; port SD_MISO_A
SD_MOSI_A: D11.4(I/O3) J8.P3(CMD) ; port SD_MOSI_A
SD_PWR_EN_A: R26.2 U9.3(ON) ; port SD_PWR_EN_A
SD_SCK_A: D11.3(I/O2) J8.P5(CLK) TP6.1 ; port SD_SCK_A
NetC47_2: C47.2 U9.4(CT)

Not connected (* = marked no-connect by the designer): D12 6(I/O4)*

### Library data of the parts
C46 = CMP-13271-001936-1: Cap Ceramic 1uF 10V X5R ±10% SMD 0402 +85°C Paper T/R; Depth: 0.5mm; Case Code (Imperial): 0402; Material: Ceramic; Mount: Surface Mount; Thickness: 0.022inch; Dielectric: X5R; Capacitance: 1uF; Radiation Hardening: No; Case/Package: 0402; Length: 1mm; Tolerance: 10%; Max Operating Temperature: 85°C; Package Quantity: 1; Width: 0.02inch; Voltage Rating: 10V; Contact Plating: Tin; Height: 0.5mm; Min Operating Temperature: -55°C; Case Code (Metric): 1005; Packaging: Tape and Reel
C47 = CMP-2008-02358-3: C0402 1,000 pF X7R 10.00% 50 V; Manufacturer Part Number: C0402C102K5RAC7411; Manufacturer: Kemet; Voltage Rating: 50 V; Material: Ceramic; Tolerance: 0.1; Temperature Coefficient: 15%; Automotive: No; Temperature Characteristic: X7R; RoHS: TRUE; Category: Cap; Temperature: -55°C to +125°C; Lead Free: Yes; Value: 1,000 pF; Device Class L1: Passive Components; Temperature Range High: +125°C; Octopart: https://octopart.com/c0402c102k5rac7411-kemet-51077941; Capacitance: 1,000 pF; Ipc Land Pattern Name: CAPC10050X50; ComponentLink2URL: https://content.kemet.com/datasheets/KEM_C1002_X7R_SMD.pdf; ComponentLink2Description: Datasheet; Device Class L2: Capacitors; Package: C0402-BB; Device Class L3: Ceramic Capacitors; Mouser Description: Cap Ceramic 0.001uF 50V X7R 10% SMD 0402 125°C Punched Paper T/R; Height: 0.55mm; Temperature Range Low: -55°C
C48 = CMP-2006-02299-1: as C8 on sheet A_Board_STM32F
C49 = CMP-13271-000002-1: CAP CER 10UF 10V X5R 0402; Manufacturer Part Number: CL05A106MP5NUNC; Manufacturer: Samsung; Temperature Coefficient: 15%; Tolerance: 20%; Material: Ceramic; Octopart: https://octopart.com/cl05a106mp5nunc-samsung-22457395; Voltage Rating: 10V; RoHS: TRUE; Value: 10uF; Height: 0.7mm; Digikey Description: CAP CER 10UF 10V X5R 0402; Automotive: No; Package: CL05A106MP5NUNC; Device Class L1: Passive Components; Capacitance: 10uF; Temperature Range High: +85°C; ComponentLink2Description: Datasheet; Device Class L2: Capacitors; Temperature Characteristic: X5R; Temperature: -55°C to +85°C; ComponentLink2URL: http://www.samsungsem.com/kr/support/product-search/mlcc/__icsFiles/afieldfile/2019/05/10/19-CL05A106MP5NUNC.pdf; Device Class L3: Ceramic Capacitors; Category: Cap; Temperature Range Low: -55°C; Ipc Land Pattern Name: CAPC10050X50; Lead Free: Yes
D11 D12 = CMP-12225-000004-1: TVS DIODE 5.25V 17V SOT23-6; Manufacturer: STMicroelectronics; Automotive Grade: Grade 0; Max Junction Temp: +150°C; Number Of Channels: 4; Standoff Height: 0mm; Breakdown Voltage: 6V; Capacitance: 3pF; Value: 3pF; Direction: Unidirectional; Peak Pulse Current: 5A; Device Class L1: Circuit Protection; Device Class L2: TVS Diodes; Octopart: https://octopart.com/usblc6-4sc6y-stmicroelectronics-20614522; ComponentLink2Description: Datasheet; RoHS: TRUE; ComponentLink2URL: https://www.st.com/resource/en/datasheet/usblc6-4sc6y.pdf; Temperature Range Low: -40°C; Package: SOT23-6L; Automotive: Yes; Mouser Description: USBLC6 Series 4 Channel 5.25 V SMT Uni-Directinal Auto ESD Protection - SOT-23-6; Device Class L3: unset; Manufacturer Part Number: USBLC6-4SC6Y; Lead Free: Yes; Temperature Range High: +150°C; Category: Diode; Height: 1.45mm; Clamping Voltage: 17V; Temperature: -40°C to +150°C; Digikey Description: TVS DIODE 5.25V 17V SOT23-6
J8 = MEM2085-00-115-00-A: Connector; Manufacturer_Name: GCT (GLOBAL CONNECTOR TECHNOLOGY); Datasheet Link: https://gct.co/files/drawings/mem2085.pdf; Height: 1.35mm; Manufacturer_Part_Number: MEM2085-00-115-00-A; Mouser Part Number: 640-MEM20850011500A; Mouser Price/Stock: https://www.mouser.co.uk/ProductDetail/GCT/MEM2085-00-115-00-A?qs=rQFj71Wb1eWNkFUhuuvVIA%3D%3D
R26 = CMP-03211-001412-1: CRGCQ0402 100KΩ 1% ±100ppm/°C 50V; Manufacturer Part Number: CRGCQ0402F100K; Manufacturer: TE Connectivity; Tolerance: 0.01; Power Rating: 0.0625W; Resistance: 100KΩ; Ambient Temperature Range High: +70°C; Series: CRGCQ; Temperature: -55°C to +155°C; Temperature Range Low: -55°C; ComponentLink2Description: Datasheet; Category: Res; Temperature Range High: +155°C; Automotive: Yes; Device Class L2: Resistors; Height: 0.4mm; Ipc Land Pattern Name: RESC10050X35; Voltage Rating: 50V; ComponentLink2URL: https://www.te.com/commerce/DocumentDelivery/DDEController?Action=showdoc&DocId=Data+Sheet%7F1773204-3%7F1%7Fpdf%7FEnglish%7FENG_DS_1773204-3_1.pdf%7F4-2176347-1150; Composition: Thick Film; Device Class L1: Passive Components; Device Class L3: Chip SMD Resistors; RoHS: TRUE; Temperature Coefficient: ±100ppm/°C; Lead Free: Yes; Value: 100KΩ; Octopart: https://octopart.com/crgcq0402f100k-te+connectivity-91017930; Package: CRGCQ0402
R27 R28 R30 = CMP-2004-03568-1: Manufacturer: TE Connectivity / AMP; Part Number: CRG0201F10K
R29 = CMP-1011-00105-2: Part Number: CRCW040220K0JNED; Manufacturer: Vishay Dale
TP4-TP6 = CMP-2000-05183-2: PC TEST POINT MINIATURE; Manufacturer Part Number: 5015; Manufacturer: keystone; Number Of Contacts: 1; Conn Orientation: Straight; Category: Conn; Digikey Description: PC TEST POINT MINIATURE; Automotive: No; Lead Free: Yes; Octopart: https://octopart.com/5015-keystone-3822; ComponentLink2URL: http://www.keyelco.com/product-pdf.cfm?p=1353; Package: 5015; RoHS: TRUE; Device Class L3: unset; Device Class L2: unset; Contact Material: Silver; Device Class L1: Connectors; Height: 1.65mm; ComponentLink2Description: Datasheet
U9 = CMP-04912-000029-1: IC PWR SWITCH P-CHAN 1:1 SOT23-6; Number of Outputs: 1; Output Configuration: High Side; Fault Protection: Reverse Current; Interface: On/Off; Max Output Current: 2A; Max Operating Temperature: 125°C; Case/Package: SOT-23-6; Packaging: Tape and Reel; Number of Channels: 1; Min Operating Temperature: -40°C

## Nets that join several sheets
GND: A_Board_Maitinimas (46 pins), A_Board_STM32F (61 pins), SD_CARD (18 pins)
VCC_3.3V_A: A_Board_Maitinimas (9 pins), A_Board_STM32F (30 pins), SD_CARD (6 pins)
NetIC3_4: A_Board_Maitinimas (IC3.4), A_Board_STM32F (U1.44)
NetIC3_6: A_Board_Maitinimas (IC3.6), A_Board_STM32F (U1.45)
PWR_HOLD_A: A_Board_Maitinimas (D6.2), A_Board_STM32F (U1.11)
PWR_SENSE_A: A_Board_Maitinimas (C34.1 R12.1 R13.2), A_Board_STM32F (U1.10)
SD_CD_A: A_Board_STM32F (U1.9), SD_CARD (D12.4 J8.CD1 R27.1 TP5.1)
SD_CS_A: A_Board_STM32F (U1.20), SD_CARD (D11.1 J8.P2 R29.1)
SD_MISO_A: A_Board_STM32F (U1.22), SD_CARD (D11.6 J8.P7)
SD_MOSI_A: A_Board_STM32F (U1.23), SD_CARD (D11.4 J8.P3)
SD_PWR_EN_A: A_Board_STM32F (U1.41), SD_CARD (R26.2 U9.3)
SD_SCK_A: A_Board_STM32F (U1.21), SD_CARD (D11.3 J8.P5 TP6.1)